# Altium schematic sheet ads1299_main.SchDoc
size A4
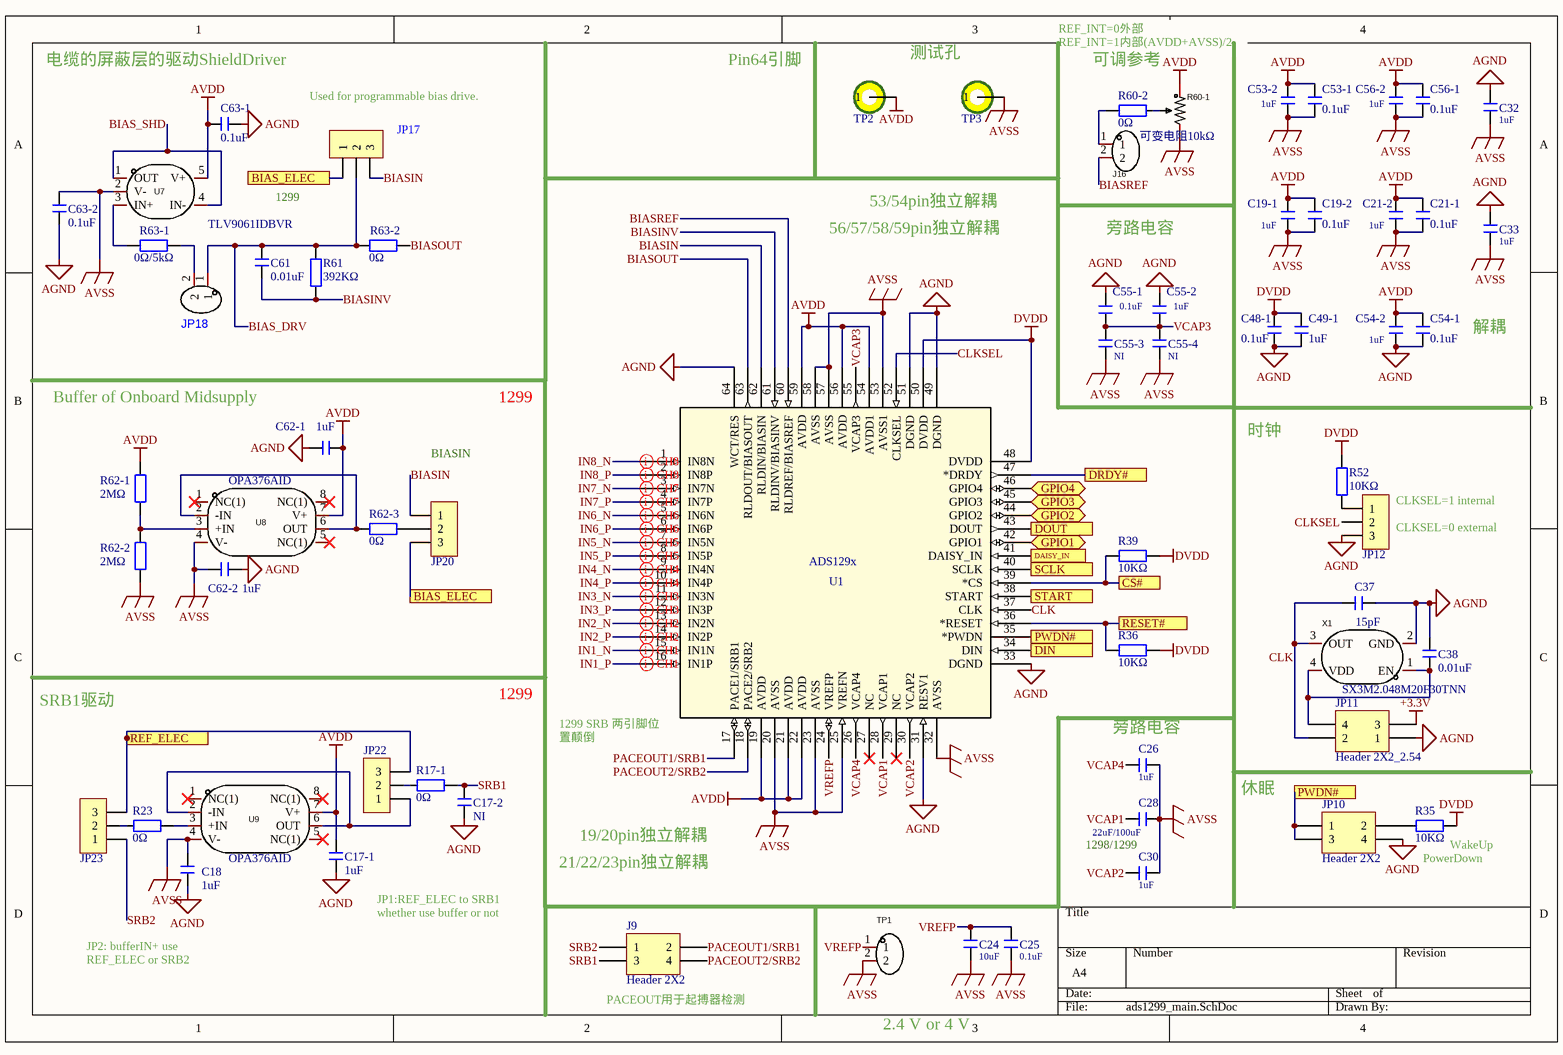
[diagram p0: ads1299_main.SchDoc]

## Parts
C17-1  1uF  [0603C]
C17-2  NI  [0603C]
C18  1uF  [0603C]
C19-1  1uF  [0603C]
C19-2  0.1uF  [0603C]
C21-1  0.1uF  [0603C]
C21-2  1uF  [0603C]
C24  10uF  [0603C]
C25  0.1uF  [0603C]
C26  1uF  [0603C]
C28  22uF/100uF  [0603C]
C30  1uF  [0603C]
C32  1uF  [0603C]
C33  1uF  [0603C]
C37  15pF  [0603C]
C38  0.01uF  [0603C]
C48-1  0.1uF  [0603C]
C49-1  1uF  [0603C]
C53-1  0.1uF  [0603C]
C53-2  1uF  [0603C]
C54-1  0.1uF  [0603C]
C54-2  1uF  [0603C]
C55-1  0.1uF  [0603C]
C55-2  1uF  [0603C]
C55-3  NI  [0603C]
C55-4  NI  [0603C]
C56-1  0.1uF  [0603C]
C56-2  1uF  [0603C]
C61  0.01uF  [0603C]
C62-1  1uF  [0603C]
C62-2  1uF  [0603C]
C63-1  0.1uF  [0603C]
C63-2  0.1uF  [0603C]
J9  Header 2X2  [HDR2.54-LI-2x2P]
J16  Header_2P_2.54  [HDR2.54-LI-2P]  (value not drawn)
JP10  Header 2X2  [HDR2.54-LI-2x2P]
JP11  Header 2X2_2.54  [HDR2.54-LI-2x2P]
JP12  HDR-1X3  [HDR2.54-LI-3P]  (value not drawn)
JP17  HDR-1X3  [HDR2.54-LI-3P]  (value not drawn)
JP18  Header_2P_2.54  [HDR2.54-LI-2P]  (value not drawn)
JP20  HDR-1X3  [HDR2.54-LI-3P]  (value not drawn)
JP22  HDR-1X3  [HDR2.54-LI-3P]  (value not drawn)
JP23  HDR-1X3  [HDR2.54-LI-3P]  (value not drawn)
R17-1  0Ω  [0603R]
R23  0Ω  [0603R]
R35  10KΩ  [0603R]
R36  10KΩ  [0603R]
R39  10KΩ  [0603R]
R52  10KΩ  [0603R]
R60-1  可变电阻10kΩ  [RES-ADJ-TH_3362P]
R60-2  0Ω  [0603R]
R61  392KΩ  [0603R]
R62-1  2MΩ  [0603R]
R62-2  2MΩ  [0603R]
R62-3  0Ω  [0603R]
R63-1  0Ω/5kΩ  [0603R]
R63-2  0Ω  [0603R]
TP1  Header_2P_2.54  [HDR2.54-LI-2P]  (value not drawn)
TP2  测试点  [TestPoint_Pad]  (value not drawn)
TP3  测试点  [TestPoint_Pad]  (value not drawn)
U1  ADS129x  [LQFP-64]
U7  TLV9061IDBVR  [SOT23-5]
U8  OPA376AID  [SOIC-8]
U9  OPA376AID  [SOIC-8]
X1  SX3M2.048M20F30TNN  [OSC 3225-4P]

## Ports
BIAS_ELEC, CS#, DAISY_IN, DIN, DOUT, DRDY#, GPIO1 (bidir), GPIO2 (bidir), GPIO3 (bidir), GPIO4 (bidir), PWDN#, REF_ELEC, RESET#, SCLK, START

## Nets
+3.3V: JP11.3
AGND: C17-1.1 C17-2.1 C18.2 C32.1 C33.1 C37.1 C38.2 C48-1.1 C49-1.1 C54-1.1 C54-2.1 C55-1.1 C55-2.1 C62-1.1 C62-2.2 C63-1.1 C63-2.2 JP10.4 JP11.1 JP12.3 U1.31(RESV1) U1.33(DGND) U1.49(DGND) U1.51(DGND) U1.64(WCT/RES) X1.2(GND)
AVDD: C17-1.2 C19-1.2 C19-2.2 C21-1.2 C21-2.2 C53-1.2 C53-2.2 C54-1.2 C54-2.2 C56-1.2 C56-2.2 C62-1.2 C63-1.2 R60-1.1 R62-1.2 TP2.1 U1.19(AVDD) U1.21(AVDD) U1.22(AVDD) U1.54(AVDD1) U1.56(AVDD) U1.59(AVDD) U7.5(V+) U8.7(V+) U9.7(V+)
AVSS: C18.1 C19-1.1 C19-2.1 C21-1.1 C21-2.1 C24.2 C25.1 C26.1 C28.1 C30.1 C32.2 C33.2 C53-1.1 C53-2.1 C55-3.2 C55-4.2 C56-1.1 C56-2.1 C62-2.1 C63-2.1 R60-1.3 R62-2.1 TP1.2 TP3.1 U1.20(AVSS) U1.23(AVSS) U1.25(VREFN) U1.32(AVSS) U1.53(AVSS1) U1.57(AVSS) U1.58(AVSS) U7.2(V-) U8.4(V-) U9.4(V-)
DVDD: C48-1.2 C49-1.2 R35.1 R36.2 R39.1 R52.2 U1.48(DVDD) U1.50(DVDD)
BIAS_DRV: C61.1 JP17.2 JP18.1 R61.2 R63-2.2
BIAS_ELEC: JP17.1 JP20.3 ; port BIAS_ELEC
BIAS_SHD: U7.1(OUT) U7.4(IN-)
BIASIN: JP17.3 JP20.1 U1.62(RLDIN/BIASIN)
BIASINV: C61.2 R61.1 U1.61(RLDINV/BIASINV)
BIASOUT: R63-2.1 U1.63(RLDOUT/BIASOUT)
BIASREF: J16.2 U1.60(RLDREF/BIASREF)
CLK: C37.2 JP11.2 U1.37(CLK) X1.3(OUT)
CLKSEL: JP12.2 U1.52(CLKSEL)
CS#: R39.2 U1.39(*CS) ; port CS#
DAISY_IN: U1.41(DAISY_IN) ; port DAISY_IN
DIN: U1.34(DIN) ; port DIN
DOUT: U1.43(DOUT) ; port DOUT
DRDY#: U1.47(*DRDY) ; port DRDY#
GPIO1: U1.42(GPIO1) ; port GPIO1
GPIO2: U1.44(GPIO2) ; port GPIO2
GPIO3: U1.45(GPIO3) ; port GPIO3
GPIO4: U1.46(GPIO4) ; port GPIO4
IN1_N: U1.15(IN1N)
IN1_P: U1.16(IN1P)
IN2_N: U1.13(IN2N)
IN2_P: U1.14(IN2P)
IN3_N: U1.11(IN3N)
IN3_P: U1.12(IN3P)
IN4_N: U1.9(IN4N)
IN4_P: U1.10(IN4P)
IN5_N: U1.7(IN5N)
IN5_P: U1.8(IN5P)
IN6_N: U1.5(IN6N)
IN6_P: U1.6(IN6P)
IN7_N: U1.3(IN7N)
IN7_P: U1.4(IN7P)
IN8_N: U1.1(IN8N)
IN8_P: U1.2(IN8P)
PACEOUT1/SRB1: J9.2 U1.17(PACE1/SRB1)
PACEOUT2/SRB2: J9.4 U1.18(PACE2/SRB2)
PWDN#: JP10.1 JP10.3 U1.35(*PWDN) ; port PWDN#
REF_ELEC: JP22.3 JP23.3 ; port REF_ELEC
RESET#: R36.1 U1.36(*RESET) ; port RESET#
SCLK: U1.40(SCLK) ; port SCLK
SRB1: C17-2.2 J9.3 R17-1.2
SRB2: J9.1 JP23.1
START: U1.38(START) ; port START
VCAP1: C28.2 U1.28(VCAP1)
VCAP2: C30.2 U1.30(VCAP2)
VCAP3: C55-1.2 C55-2.2 C55-3.1 C55-4.1 U1.55(VCAP3)
VCAP4: C26.2 U1.26(VCAP4)
VREFP: C24.1 C25.2 TP1.1 U1.24(VREFP)
NetC38_1: C38.1 JP11.4 X1.1(EN) X1.4(VDD)
NetJ16_1: J16.1 R60-2.2
NetJP10_2: JP10.2 R35.2
NetJP12_1: JP12.1 R52.1
NetJP18_2: JP18.2 R63-1.2
NetJP20_2: JP20.2 R62-3.2
NetJP22_1: JP22.1 U9.2(-IN) U9.6(OUT)
NetJP22_2: JP22.2 R17-1.1
NetJP23_2: JP23.2 R23.1
NetR23_2: R23.2 U9.3(+IN)
NetR60-1_2: R60-1.2 R60-2.1
NetR62-1_1: R62-1.1 R62-2.2 U8.3(+IN)
NetR62-3_1: R62-3.1 U8.2(-IN) U8.6(OUT)
NetR63-1_1: R63-1.1 U7.3(IN+)

Not connected (* = marked no-connect by the designer): U1 27(NC)* 29(NC)*; U8 1(NC(1))* 5(NC(1))* 8(NC(1))*; U9 1(NC(1))* 5(NC(1))* 8(NC(1))*

## Layout directives
differential pair: IN1_N, IN1_P, IN2_N, IN2_P, IN3_N, IN3_P, IN4_N, IN4_P, IN5_N, IN5_P, IN6_N, IN6_P, IN7_N, IN7_P, IN8_N, IN8_P

## Notes on the sheet
- REF_INT=0外部
  REF_INT=1内部(AVDD+AVSS)/2
- 电缆的屏蔽层的驱动ShieldDriver
- Used for programmable bias drive.
- Pin64引脚
- 测试孔
- 可调参考
- 1299
- 56/57/58/59pin独立解耦
- 53/54pin独立解耦
- 旁路电容
- 解耦
- Buffer of Onboard Midsupply
- BIASIN
- 时钟
- (near JP12) CLKSEL=0 external
- CLKSEL=1 internal
- SRB1驱动
- (near U1) 1299 SRB 两引脚位置颠倒
- (near C26) 旁路电容
- 休眠
- 19/20pin独立解耦
- 1298/1299
- (near R35) PowerDown
- (near R35) WakeUp
- (near C17-1) JP1:REF_ELEC to SRB1
  whether use buffer or not
- 21/22/23pin独立解耦
- JP2: bufferIN+ use
  REF_ELEC or SRB2
- (near J9) PACEOUT用于起搏器检测
- 2.4 V or 4 V

## Library data of the parts
C17-1 C17-2 C18 C19-1 C19-2 C21-1 C21-2 C24-C26 C28 C30 C32 C33 C37 C38 C48-1 C49-1 C53-1 C53-2 C54-1 C54-2 C55-1-C55-4 C56-1 C56-2 C61 C62-1 C62-2 C63-1 C63-2 = C: Chip  Ceramic Capacitor; BOM名称: 无极性贴片电容; 版权归属: 源创客; 学习资源: www.ooocke.com
J9 JP10 = Header 2X2: Header, 2-Pin, Dual row; LatestRevisionDate: 17-Jul-2002; LatestRevisionNote: Re-released for DXP Platform.; Publisher: Altium Limited
J16 JP18 TP1 = Header_2P_2.54: Manufacturer: MOLEX; Name: 22284020; Add into BOM: yes; Pitch: 2.54mm; Pin Structure: 1x2P; Circluar Pins/Square Pins: 方针; Symbol: 22-28-4020; Device: 22284020; LCSC Part Name: 2.54mm 1x2P 直插 方针; Supplier Part: C234182; Manufacturer Part: 22284020; Supplier Footprint: 直插,P=2.54mm; JLCPCB Part Class: Extended Part; Datasheet: https://atta.szlcsc.com/upload/public/pdf/source/20180801/C234182_F77B1C2A9EF8AC9B34CEB7670B45930E.pdf; Supplier: LCSC; Convert to PCB: yes; Number of Pins: 2; Number of Rows: 1; Row Spacing: -; Mounting Type: 直插; Current Rating (Max): -; Voltage Rating (Max): -; Length of Mating Pin: -; Insulation Height: -; Contact Material: 黄铜; Contact Plating: -; Color: 黑色
JP11 = Header 2X2_2.54: Header, 2-Pin, Dual row; LatestRevisionDate: 17-Jul-2002; LatestRevisionNote: Re-released for DXP Platform.; Publisher: Altium Limited
JP12 JP17 JP20 JP22 JP23 = Header 3: 3P接插件; 版权归属: 源创客; BOM名称: 3P接插件; 学习资源: www.ooocke.com
R17-1 R23 R35 R36 R39 R52 R60-2 R61 R62-1-R62-3 R63-1 R63-2 = R: 贴片电阻; 版权归属: 源创客; BOM名称: 贴片电阻; 学习资源: www.ooocke.com
R60-1 = 3362P-1-103: Manufacturer: BOCHEN(博晨); Name: 10kΩ; Symbol: 3362P-1-103_C118956; Add into BOM: yes; Value: 10kΩ; Tolerance: ±10%; Device: 3362P-1-103; LCSC Part Name: 10kΩ ±10%; Supplier Part: C118956; Manufacturer Part: 3362P-1-103; Supplier Footprint: 插件; JLCPCB Part Class: Extended Part; Datasheet: https://atta.szlcsc.com/upload/public/pdf/source/20171114/C118956_15106326650691117445.pdf; Supplier: LCSC; Convert to PCB: yes
TP2 TP3 = TestPoint
U1 = ADS129x: ECG,EEG; Mfr_Name: Texas Instruments; Manufacturer_Part_Number: ADS131E08SPAG; Copyright: Copyright (C) 2022 Ultra Librarian. All rights reserved.; RefDes: RefDes; Type: DEV
U7 = TLV9061IDBVR: Manufacturer: TI(德州仪器); Add into BOM: yes; Name: TLV9061IDBVR; Symbol: TLV9061IDBVR; Device: TLV9061IDBVR; LCSC Part Name: TLV9061IDBVR; Supplier Part: C398358; Manufacturer Part: TLV9061IDBVR; Supplier Footprint: SOT-23-5; JLCPCB Part Class: Extended Part; Datasheet: https://atta.szlcsc.com/upload/public/pdf/source/20190614/C398358_49FE9762020E71441728160F646E231F.pdf; Supplier: LCSC; Convert to PCB: yes; Amplifier Type: -; Number of Circuits: -; -3db Bandwidth（G=1）: -; Current - Input Bias（Ib）: -; Voltage - Input Offset（Vos）: -; Gain Bandwidth Product（GBP）: -; Slew Rate（SR）: -; Output Type: -; Supply Voltage（Single）: -; Iq per channel (Typ): -; Operating Temperature: -
U8 U9 = OPA376AID: Manufacturer: TI(德州仪器); Add into BOM: yes; Name: OPA376AID; Symbol: OPA376AID; Device: OPA376AID; LCSC Part Name: OPA376AID; Supplier Part: C1347528; Manufacturer Part: OPA376AID; Supplier Footprint: SOIC-8; JLCPCB Part Class: Extended Part; Datasheet: https://atta.szlcsc.com/upload/public/pdf/source/20210701/9FC12D00E1332600214DE3C63939EFF5.pdf; Supplier: LCSC; Convert to PCB: yes
X1 = SX3M2.048M20F30TNN: Manufacturer: SCTF(星通时频); Name: 2.048MHz; Add into BOM: yes; Value: 2.048MHz; Frequency Stability: ±20ppm; Supply Voltage: 1.62V~3.63V; Supply Current (Max): 10mA; Output Type: CMOS; Symbol: SX3M2.048M20F30TNN; Device: SX3M2.048M20F30TNN; LCSC Part Name: 2.048MHz ±20ppm 1.62V~3.63V CMOS; Supplier Part: C2901549; Manufacturer Part: SX3M2.048M20F30TNN; Supplier Footprint: SMD3225-4P; JLCPCB Part Class: Extended Part; Datasheet: https://atta.szlcsc.com/upload/public/pdf/source/20211009/2941C931EA31459006A6A1B668A18381.pdf; Supplier: LCSC; Convert to PCB: yes; Operating Temperature: -40℃~+85℃